# Altium project EN2091_Analog_Project.PrjPcb
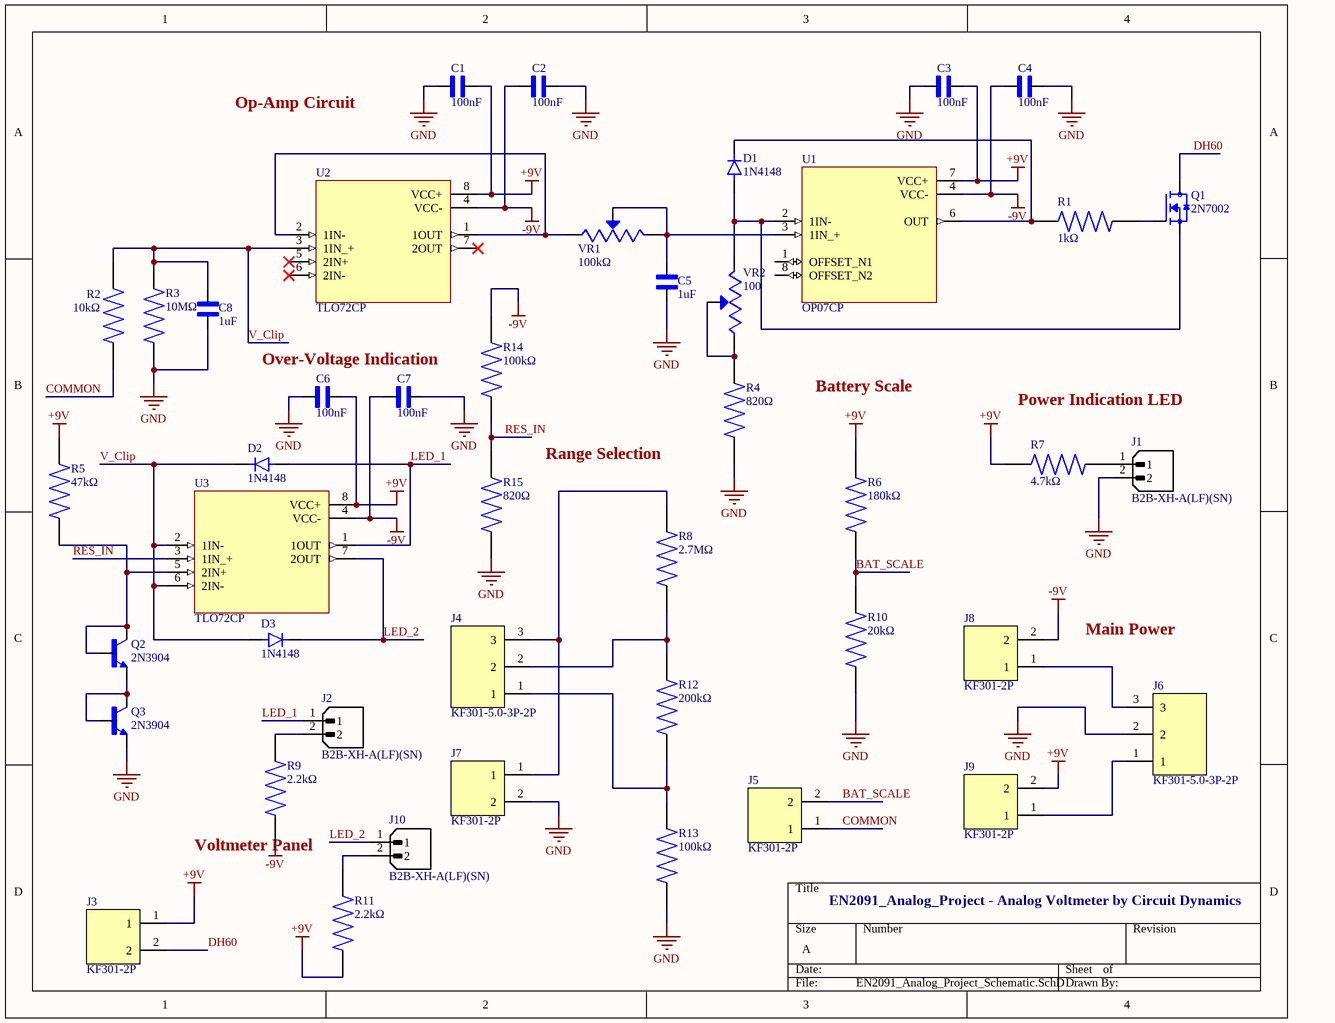
[diagram p0: EN2091_Analog_Project_Schematic.SchDoc]
1 sheet, 44 parts. Net scope: global (net labels, ports and power ports of the same name join across sheets).
Board file: EN2091_Analog_Project_PCB.PcbDoc

## Sheet EN2091_Analog_Project_Schematic.SchDoc: Analog Voltmeter
size A; SheetNumber: 1; SheetTotal: 1

### Parts
C1  100nF  [CAPC2012X95N]
C2  100nF  [CAPC2012X95N]
C3  100nF  [CAPC2012X95N]
C4  100nF  [CAPC2012X95N]
C5  1uF  [CAPC2012X135N]
C6  100nF  [CAPC2012X95N]
C7  100nF  [CAPC2012X95N]
C8  1uF  [CAPC2012X135N]
D1  1N4148  [AXIAL_017AG_T26_ONS]
D2  1N4148  [AXIAL_017AG_T26_ONS]
D3  1N4148  [AXIAL_017AG_T26_ONS]
J1  B2B-XH-A(LF)(SN)  [JST_B2B-XH-A(LF)(SN)]
J2  B2B-XH-A(LF)(SN)  [JST_B2B-XH-A(LF)(SN)]
J3  KF301-2P  [HANDSON_KF301-2P]
J4  KF301-5.0-3P-2P  [HANDSON_KF301-3P]
J5  KF301-2P  [HANDSON_KF301-2P]
J6  KF301-5.0-3P-2P  [HANDSON_KF301-3P]
J7  KF301-2P  [HANDSON_KF301-2P]
J8  KF301-2P  [HANDSON_KF301-2P]
J9  KF301-2P  [HANDSON_KF301-2P]
J10  B2B-XH-A(LF)(SN)  [JST_B2B-XH-A(LF)(SN)]
Q1  2N7002  [TRANS_2N7002]
Q2  2N3904  [TO92254P460H750-3]
Q3  2N3904  [TO92254P460H750-3]
R1  1kΩ  [RESAD1100W55L680D260]
R2  10kΩ  [RESAD1100W55L680D260]
R3  10MΩ  [RESAD1100W55L680D260]
R4  820Ω  [RESAD1100W55L680D260]
R5  47kΩ  [RESAD1100W55L680D260]
R6  180kΩ  [RESAD1100W55L680D260]
R7  4.7kΩ  [RESAD1100W55L680D260]
R8  2.7MΩ  [RESAD1100W55L680D260]
R9  2.2kΩ  [RESAD1100W55L680D260]
R10  20kΩ  [RESAD1100W55L680D260]
R11  2.2kΩ  [RESAD1100W55L680D260]
R12  200kΩ  [RESAD1100W55L680D260]
R13  100kΩ  [RESAD1100W55L680D260]
R14  100kΩ  [RESAD1100W55L680D260]
R15  820Ω  [RESAD1100W55L680D260]
U1  OP07CP  [DIP794W45P254L959H508Q8]
U2  TLO72CP  [DIP794W45P254L959H508Q8]
U3  TLO72CP  [DIP794W45P254L959H508Q8]
VR1  100kΩ  [TRIM_3296W-1-104LF]
VR2  100  [TRIM_3296W-1-101]

### Nets
+9V: C1.2 C3.2 C6.2 J3.1 J9.2 R5.1 R6.2 R7.1 R11.1 U1.7(VCC+) U2.8(VCC+) U3.8(VCC+)
-9V: C2.1 C4.1 C7.1 J8.2 R9.1 R14.2 U1.4(VCC-) U2.4(VCC-) U3.4(VCC-)
GND: C1.1 C2.2 C3.1 C4.2 C5.1 C6.1 C7.2 C8.1 J1.2 J6.2 J7.2 Q3.1(E) R3.1 R4.1 R10.1 R13.1 R15.1
BAT_SCALE: J5.2 R6.1 R10.2
COMMON: J5.1 R2.1
DH60: J3.2 Q1.3(D)
LED_1: D2.2 J2.1 U3.1(1OUT)
LED_2: D3.1 J10.1 U3.7(2OUT)
RES_IN: R14.1 R15.2 U3.3(1IN_+)
V_Clip: C8.2 D2.1 D3.2 R2.2 R3.2 U2.3(1IN_+) U3.2(1IN-) U3.6(2IN-)
NetC5_2: C5.2 U1.3(1IN_+) VR1.2(WIPER) VR1.3(CW)
NetD1_1: D1.1 R1.1 U1.6(OUT)
NetD1_2: D1.2 Q1.2(S) U1.2(1IN-) VR2.3(CW)
NetJ1_1: J1.1 R7.2
NetJ2_2: J2.2 R9.2
NetJ4_1: J4.1 R12.1 R13.2
NetJ4_2: J4.2 R8.1 R12.2
NetJ4_3: J4.3 J7.1 R8.2
NetJ6_1: J6.1 J9.1
NetJ6_3: J6.3 J8.1
NetJ10_2: J10.2 R11.2
NetQ1_1: Q1.1(G) R1.2
NetQ2_1: Q2.1(E) Q3.2(B) Q3.3(C)
NetQ2_2: Q2.2(B) Q2.3(C) R5.2 U3.5(2IN+)
NetR4_2: R4.2 VR2.1(CCW) VR2.2(WIPER)
NetU2_1: U2.1(1OUT) U2.2(1IN-) VR1.1(CCW)

Not connected (* = marked no-connect by the designer): U1 1(OFFSET_N1) 8(OFFSET_N2); U2 5(2IN+)* 6(2IN-)* 7(2OUT)*

### Notes on the sheet
- Op-Amp Circuit
- Over-Voltage Indication
- Battery Scale
- Power Indication LED
- Range Selection
- Main Power
- Voltmeter Panel
- EN2091_Analog_Project - Analog Voltmeter by Circuit Dynamics

### Library data of the parts
C1-C4 C6 C7 = CL21B104KBCNNNC: 100nF 50V X7R ±10% 0805 Multilayer Ceramic Capacitors MLCC - SMD/SMT ROHS; MF: Samsung Electro-Mechanics; SnapEDA_Link: https://www.snapeda.com/parts/CL21B104KBCNNNC/Samsung/view-part/?ref=snap; Package: SMD-2 Samsung; Value: 100nF; MP: CL21B104KBCNNNC; Check_prices: https://www.snapeda.com/parts/CL21B104KBCNNNC/Samsung/view-part/?ref=eda; LCSC Part Number: C1711; JLCPCB Part Number: C1711; Packaging: 0805; Datasheet: https://jlc-prod-smt.oss-eu-central-1.aliyuncs.com/smtDataManualFile/8586177282230652928-C1711.pdf?response-content-disposition=attachment%3B%20filename%3DC1711.pdf%3B%20filename%2A%3DUTF-8%27%27C1711.pdf&x-oss-date=20260824T081709Z&x-oss-expires=1800&x-oss-security-token=CAISgAN1q6Ft5B2yfSjIr5mGHfDOn7QT7o%2BxUBDlk1MZdulkpK3jlDz2IHhMdHJsAOodtv0%2FmmhT6PkclqRLcbhpcmfjV%2BZHzLB8qZEGg3sq557b16cNrbH4M4H6aXeirtuwDsz9SNTCALjPD3nPii50x5bjaDymRCbLGJaViJlhHLN1Ow6jdmhpCctxLAlvo9NgFxm3D%2Fu2NQPwiWf9FVdhvhEG6Vly8qOi2MaRmFy8yFTx0b0SvJ%2BjYMrmPctoN9JnSdC5mfdzau3a1TJ84gRD0a5wkaVA1zbDs5bfISEIuUzebreLqY03dV4mOvdqIcMe8qigz88fk%2FfIioH6xyxKOexoSCnFTOiiupCcQLPyao9jLu6iayqViY7QaIOTqQohZmkAMwVOasAsI3Ngh4zF97Qt0cVNkXO9gWfLI8DtuMleWgooUt9U86HD0eS19jklBdzSlusJRAJJUVBflCeKEaRNSAd3WGhEfM2%2BBt4QT30w5N2u00S8OSMI7RV3BqKWD5sagAGgO1DD6BoixGcj7OM8XS0gibNrLNvx9htutE794D0zttbwnpxTrwll4sF3BZcc4f4feWxI7%2Bt9GmtQtPB9CcN1OsLaOdxgI0xrNzXh3GP5koq13GIWxRMcGYuQFx2sstxck4NbO5PxcqvOTQCJgYZ8SZgvAsPo3E1SdW304xHJtyAA&x-oss-signature-version=OSS4-HMAC-SHA256&x-oss-credential=STS.NZ3VJzrk2YMZR6TwSLzfHKhHv%2F20260824%2Feu-central-1%2Foss%2Faliyun_v4_request&x-oss-signature=b522eb2391a6902924f48a327a7f41585dc420bf07b5c2db532034d436f7e6a7
C5 C8 = CL21B105KBFNNNE: 1uF 50V X7R ±10% 0805 Multilayer Ceramic Capacitors MLCC - SMD/SMT ROHS; MF: Samsung Electro-Mechanics; SnapEDA_Link: https://www.snapeda.com/parts/CL21B105KBFNNNE/Samsung/view-part/?ref=snap; Package: SMD-2 Samsung; Value: 1uF; MP: CL21B105KBFNNNE; Check_prices: https://www.snapeda.com/parts/CL21B105KBFNNNE/Samsung/view-part/?ref=eda; LCSC Part Number: C28323; JLCPCB Part Number: C28323; Packaging: 0805
D1-D3 = 1N4148: -55℃~+175℃@(Tj) 1 Independent 100V 1V@10mA 200mA 4A 4ns 500mW 5uA@75V DO-35 Switching Diodes ROHS; MF: onsemi; SnapEDA_Link: https://www.snapeda.com/parts/1N4148/Onsemi/view-part/?ref=snap; Package: AXIAL LEAD-2 ON Semiconductor; Value: *; MP: 1N4148; Check_prices: https://www.snapeda.com/parts/1N4148/Onsemi/view-part/?ref=eda; LCSC Part Number: C258182; JLCPCB Part Number: C258182; Packaging: DO-35; ComponentLink1Description: Datasheet; ComponentLink1URL: https://jlc-prod-smt.oss-eu-central-1.aliyuncs.com/smtDataManualFile/8588891516693987328-C258182.pdf?response-content-disposition=attachment%3B%20filename%3DC258182.pdf%3B%20filename%2A%3DUTF-8%27%27C258182.pdf&x-oss-date=20260824T123915Z&x-oss-expires=1800&x-oss-security-token=CAISgAN1q6Ft5B2yfSjIr5nHLfzkqI4Zj7uFb1Hwr3kzdMRFu6LJ0Dz2IHhMdHJsAOodtv0%2FmmhT6PkclqRLcbhpcmfjV%2BZHzLB8qb4h%2FEIq557b16cNrbH4M4H6aXeirtuwDsz9SNTCALjPD3nPii50x5bjaDymRCbLGJaViJlhHLN1Ow6jdmhpCctxLAlvo9NgFxm3D%2Fu2NQPwiWf9FVdhvhEG6Vly8qOi2MaRmFy8yFTx0b0SvJ%2BjYMrmPctoN9JnSdC5mfdzau3a1TJ84gRD0a5wkaVA1zbDs5bfISEIuUzebreLqY03dV4mOvdqIcMe8qigz88fk%2FfIioH6xyxKOexoSCnFTOiiupCcQLPyao9jLu6iayqViY7QaIOTqQohZmkAMwVOasAsI3Ngh4zF97Qt0cVNkXO9gWfLI8DtuMleWkqnSf1c86HD0eS19jklBdzSlusJRAJJUVBflCeKEaRNSAd3WGhEfM2%2BBt4QT30w5N2u00S8OSMI7u2NB6KWD5sagAGr3foMo08u0hg4sPaEAhHejaX1K1vtCq0Rs3qdLPQjOHAU3bA2D2pDPhPzXRnKBDFNRw25yQAe0B8ZutJyzVczHfRc5aN9y5%2BVFQff1we5D3ylmkox3228fiPTPzdY0dulDcVIUusk1MruY%2FGuZ4TocXsP7T7%2BnIgiC75d%2B8yAUSAA&x-oss-signature-version=OSS4-HMAC-SHA256&x-oss-credential=STS.NZrfFPEQ88ynmwAKyfxKiTgb2%2F20260824%2Feu-central-1%2Foss%2Faliyun_v4_request&x-oss-signature=7d31f57c4ca03725e030b844e767f49808b97d5660530bc99b6cfe814330b3c1
J1 J2 J10 = B2B-XH-A(LF)(SN): Connector Header Through Hole 2 position 0.098 (2.50mm); MF: XYECONN; MP: XY-B2B-XH-A; SnapEDA_Link: https://www.snapeda.com/parts/B2B-XH-A(LF)(SN)/JST/view-part/?ref=snap; Package: None; Value: *; Check_prices: https://www.snapeda.com/parts/B2B-XH-A(LF)(SN)/JST/view-part/?ref=eda; LCSC Part Number: C51940134; JLCPCB Part Number: C51940134; ComponentLink1Description: Datasheet; ComponentLink1URL: https://jlc-prod-smt.oss-eu-central-1.aliyuncs.com/smtDataManualFile/8756873389292032000-C51940134.pdf?response-content-disposition=attachment%3B%20filename%3DC51940134.pdf%3B%20filename%2A%3DUTF-8%27%27C51940134.pdf&x-oss-date=20260825T073214Z&x-oss-expires=1800&x-oss-security-token=CAISgAN1q6Ft5B2yfSjIr5vHL4nsm71Gw%2FTYUEzanjcPNNsbqIb5oTz2IHhMdHJsAOodtv0%2FmmhT6PkclqRLcbhpcmfjV%2BZHzLB8qfZMiiAq557b16cNrbH4M4H6aXeirtuwDsz9SNTCALjPD3nPii50x5bjaDymRCbLGJaViJlhHLN1Ow6jdmhpCctxLAlvo9NgFxm3D%2Fu2NQPwiWf9FVdhvhEG6Vly8qOi2MaRmFy8yFTx0b0SvJ%2BjYMrmPctoN9JnSdC5mfdzau3a1TJ84gRD0a5wkaVA1zbDs5bfISEIuUzebreLqY03dV4mOvdqIcMe8qigz88fk%2FfIioH6xyxKOexoSCnFTOiiupCcQLPyao9jLu6iayqViY7QaIOTqQohZmkAMwVOasAsI3Ngh4zF97Qt0cVNkXO9gWfLI8DtuMleWmpmXdk%2B86HD0eS19jklBdzSlusJRAJJUVBflCeKEaRNSAd3WGhEfM2%2BBt4QT30w5N2u00S8OSMIxfnStaKWD5sagAGDiiDi0jkdUes8cqMbd0CGciys9ki7pIZkKsKqj9ZCxgmTVFKmonOvhB0GCq%2B31OjjHM0VTB2zOVgjvkRo1ZZOD%2FLtMbwaPXos31FS3eqvfpK6qEPBU1QuFMi8nemEpSEsfpKHEGo3PQQniW1S1jM94Dta3jYoawqx25WNx82BmSAA&x-oss-signature-version=OSS4-HMAC-SHA256&x-oss-credential=STS.NXrd3Xvbgt63Rjkz7Z8T7GCRC%2F20260825%2Feu-central-1%2Foss%2Faliyun_v4_request&x-oss-signature=ea0af44fa6bb8676878fee5e34cce7cfde54a6f68248ff1658e78184a3f7ef54
J3 J5 J7-J9 = KF301-2P: 2 Pin Terminal Block 5mm Pitch / -30℃~+120℃ 1 1.5 14~22 17A 1x2P 2 250V 2P 5mm Blue Through Hole 插件,P=5mm Screw Terminal Blocks ROHS; MF: Handson Technology; SnapEDA_Link: https://www.snapeda.com/parts/KF301-2P/Handson+Technology/view-part/?ref=snap; Package: None; Value: *; MP: KF301-2P; Check_prices: https://www.snapeda.com/parts/KF301-2P/Handson+Technology/view-part/?ref=eda; LCSC Part Number: C474881; JLCPCB Part Number: C474881; ComponentLink1Description: Datasheet; ComponentLink1URL: https://jlc-prod-smt.oss-eu-central-1.aliyuncs.com/smtDataManualFile/8588888669994561536-C474881.pdf?response-content-disposition=attachment%3B%20filename%3DC474881.pdf%3B%20filename%2A%3DUTF-8%27%27C474881.pdf&x-oss-date=20260825T075455Z&x-oss-expires=1800&x-oss-security-token=CAISgAN1q6Ft5B2yfSjIr5vHL4nsm71Gw%2FTYUEzanjcPNNsbqIb5oTz2IHhMdHJsAOodtv0%2FmmhT6PkclqRLcbhpcmfjV%2BZHzLB8qfZMiiAq557b16cNrbH4M4H6aXeirtuwDsz9SNTCALjPD3nPii50x5bjaDymRCbLGJaViJlhHLN1Ow6jdmhpCctxLAlvo9NgFxm3D%2Fu2NQPwiWf9FVdhvhEG6Vly8qOi2MaRmFy8yFTx0b0SvJ%2BjYMrmPctoN9JnSdC5mfdzau3a1TJ84gRD0a5wkaVA1zbDs5bfISEIuUzebreLqY03dV4mOvdqIcMe8qigz88fk%2FfIioH6xyxKOexoSCnFTOiiupCcQLPyao9jLu6iayqViY7QaIOTqQohZmkAMwVOasAsI3Ngh4zF97Qt0cVNkXO9gWfLI8DtuMleWmpmXdk%2B86HD0eS19jklBdzSlusJRAJJUVBflCeKEaRNSAd3WGhEfM2%2BBt4QT30w5N2u00S8OSMIxfnStaKWD5sagAGDiiDi0jkdUes8cqMbd0CGciys9ki7pIZkKsKqj9ZCxgmTVFKmonOvhB0GCq%2B31OjjHM0VTB2zOVgjvkRo1ZZOD%2FLtMbwaPXos31FS3eqvfpK6qEPBU1QuFMi8nemEpSEsfpKHEGo3PQQniW1S1jM94Dta3jYoawqx25WNx82BmSAA&x-oss-signature-version=OSS4-HMAC-SHA256&x-oss-credential=STS.NXrd3Xvbgt63Rjkz7Z8T7GCRC%2F20260825%2Feu-central-1%2Foss%2Faliyun_v4_request&x-oss-signature=bbaa85c5a5c7e0f3858a29c7e7e1ce60f942b031d33e9564a46d8b874bcb652f
J4 J6 = KF301-5.0-3P: -30℃~+120℃ 1 1.5 14~22 17A 1x3P 250V 3 3P 5mm Blue Through Hole 插件,P=5mm Screw Terminal Blocks ROHS; MF: Cixi Kefa Elec; Package: None; Value: *; MP: KF301-5.0-3P; LCSC Part Number: C474882; JLCPCB Part Number: C474882; ComponentLink1Description: Datasheet; ComponentLink1URL: https://jlc-prod-smt.oss-eu-central-1.aliyuncs.com/smtDataManualFile/8588888670002139136-C474882.pdf?response-content-disposition=attachment%3B%20filename%3DC474882.pdf%3B%20filename%2A%3DUTF-8%27%27C474882.pdf&x-oss-date=20260825T083909Z&x-oss-expires=1800&x-oss-security-token=CAISgAN1q6Ft5B2yfSjIr5rwIOuAjLBXwqqKMWTCgWMCOtsegaHIujz2IHhMdHJsAOodtv0%2FmmhT6PkclqRLcbhpcmfjV%2BZHzLB8qZALwSEq557b16cNrbH4M4H6aXeirtuwDsz9SNTCALjPD3nPii50x5bjaDymRCbLGJaViJlhHLN1Ow6jdmhpCctxLAlvo9NgFxm3D%2Fu2NQPwiWf9FVdhvhEG6Vly8qOi2MaRmFy8yFTx0b0SvJ%2BjYMrmPctoN9JnSdC5mfdzau3a1TJ84gRD0a5wkaVA1zbDs5bfISEIuUzebreLqY03dV4mOvdqIcMe8qigz88fk%2FfIioH6xyxKOexoSCnFTOiiupCcQLPyao9jLu6iayqViY7QaIOTqQohZmkAMwVOasAsI3Ngh4zF97Qt0cVNkXO9gWfLI8DtuMleWgrAlsTAJjvyAFpORa%2Bb5wchMHn6pr9EWOXuJZUIn3b%2FstWNupKq5ldctHSeoXq108CXVnU5PXYIxekA9aKWD5sagAEUyPntyVyU4V2IqafEejF6luaUGOW8giT03zBmI%2F4BLLNNju2GWhPwbRm8GlAGTmkaDwxIN4%2Bg6sd2cUpZg6tRnuiIoRrRfPgk9f8sDOnBhHkSyvlZEJc0XYnr%2F5yKzo8GBOg%2BMmFY724RtfEMwd4PQLZAoVJL30q4tKoTMBKqVSAA&x-oss-signature-version=OSS4-HMAC-SHA256&x-oss-credential=STS.NYEkQ4aovuha3BsecW6T2ndcX%2F20260825%2Feu-central-1%2Foss%2Faliyun_v4_request&x-oss-signature=8e8a3bf5e7e8f5cc52ed862cda921fd13cbe209f163a0669e8eafba254ac342d
Q1 = 2N7002: MOSFET, SOT-23, N, 60V, 0.28A, 5|, 150°C / 1 N-channel 115mA 2.5V 225mW 25pF 50pF 5pF 5Ω@10V 60V N-Channel ±20V SOT-23 MOSFETs ROHS; MF: Diotec Semiconductor; SnapEDA_Link: https://www.snapeda.com/parts/2N7002/Diotec/view-part/?ref=snap; Package: SOT-23 Diotec; Value: *; MP: 2N7002; Check_prices: https://www.snapeda.com/parts/2N7002/Diotec/view-part/?ref=eda; LCSC Part Number: C8545; JLCPCB Part Number: C8545; Packaging: SOT-23; ComponentLink1Description: Datasheet; ComponentLink1URL: https://jlc-prod-smt.oss-eu-central-1.aliyuncs.com/smtDataManualFile/8550724090240786432-C8545.pdf?response-content-disposition=attachment%3B%20filename%3DC8545.pdf%3B%20filename%2A%3DUTF-8%27%27C8545.pdf&x-oss-date=20260824T115715Z&x-oss-expires=1800&x-oss-security-token=CAISgAN1q6Ft5B2yfSjIr5nXMuv%2BvJV0wLuud0CI01ctdutUt%2FLArjz2IHhMdHJsAOodtv0%2FmmhT6PkclqRLcbhpcmfjV%2BZHzLB8qYl7pX0q557b16cNrbH4M4H6aXeirtuwDsz9SNTCALjPD3nPii50x5bjaDymRCbLGJaViJlhHLN1Ow6jdmhpCctxLAlvo9NgFxm3D%2Fu2NQPwiWf9FVdhvhEG6Vly8qOi2MaRmFy8yFTx0b0SvJ%2BjYMrmPctoN9JnSdC5mfdzau3a1TJ84gRD0a5wkaVA1zbDs5bfISEIuUzebreLqY03dV4mOvdqIcMe8qigz88fk%2FfIioH6xyxKOexoSCnFTOiiupCcQLPyao9jLu6iayqViY7QaIOTqQohZmkAMwVOasAsI3Ngh4zF97Qt0cVNkXO9gWfLI8DtuMleWorpROZs86HD0eS19jklBdzSlusJRAJJUVBflCeKEaRNSAd3WGhEfM2%2BBt4QT30w5N2u00S8OSMIdZUZHKKWD5sagAGIeDksTl0Jm8kDpNZyqXpos4Fia7krhozzbA5lHdi6hZhStnsllffk9Jy6LPikYdJXwHUZMD5tauOV%2FJMMuvlTmOopNPyucKakhx7CKF22jSXQNt5usakIFMasHgZAabS%2FMCHZQVcujW3F%2B80DFAHUjbh%2B1%2FCP8kr3l2njSUlPuCAA&x-oss-signature-version=OSS4-HMAC-SHA256&x-oss-credential=STS.NZbyQJQJUwyEuf97WxzdxX7kL%2F20260824%2Feu-central-1%2Foss%2Faliyun_v4_request&x-oss-signature=f53d934e69d13818cb32edbd0d068395a096e2f8396aa90dd858349e40b679ed
Q2 Q3 = 2N3904: 1 NPN 100 200mA 300MHz 300mV 40V 50nA 625mW 6V NPN TO-92 Bipolar (BJT) ROHS; MF: Diotec Semiconductor; SnapEDA_Link: https://www.snapeda.com/parts/2N3904/Diotec/view-part/?ref=snap; Package: TO-92 Diotec; Value: *; MP: 2N3904; Check_prices: https://www.snapeda.com/parts/2N3904/Diotec/view-part/?ref=eda; JLCPCB Part Number: C118538; LCSC Part Number: C118538; Packaging: TO-92; ComponentLink1Description: Datasheet; ComponentLink1URL: https://jlc-prod-smt.oss-eu-central-1.aliyuncs.com/smtDataManualFile/8588887652326387712-C118538.pdf?response-content-disposition=attachment%3B%20filename%3DC118538.pdf%3B%20filename%2A%3DUTF-8%27%27C118538.pdf&x-oss-date=20260911T151354Z&x-oss-expires=1800&x-oss-security-token=CAISgAN1q6Ft5B2yfSjIr5r9CI7lmOhw0YeyZVLIjkcBdcR9gfOa0Dz2IHhMdHJsAOodtv0%2FmmhT6PkclqRLcbhpcmfjV%2BZHzLB8qfNbr2kg557b16cNrbH4M4H6aXeirtuwDsz9SNTCALjPD3nPii50x5bjaDymRCbLGJaViJlhHLN1Ow6jdmhpCctxLAlvo9NgFxm3D%2Fu2NQPwiWf9FVdhvhEG6Vly8qOi2MaRmFy8yFTx0b0SvJ%2BjYMrmPctoN9JnSdC5mfdzau3a1TJ84gRD0a5wkaVA1zbDs5bfISEIuUzebreLqY03dV4mOvdqIcMe8qigz88fk%2FfIioH6xyxKOexoSCnFTOiiupCcQLPyao9jLu6iayqViY7QaIOTqQohZmkAMwVOasAsI3Ngh4zF97Qt0cVNkXO9gWfLI8DtuMleWmpsRHD7MjvyAFpORa%2Bb5wchMHn6pr9EWOXuJZUIn3b%2FstWNupKq5ldctHSeoXq108CXVnU5PXYIwBNhyqKWD5sagAG1Z1Ko3snZsjO1a1IJYsOspEmZv0%2BXU7OWdkAiwCQrcVVnAyAHbGZ8aZQx2jgys%2BVPP%2BjAliJD6sDK0ERwYbIs0pE%2F%2FOGQAkhN6WXgpQltR1W2sWSdxX5ATy6ua1TtneTFxF379HftCAEbgKOmHPbiz9tzW%2FV9N%2FCwVMnmnzFeoCAA&x-oss-signature-version=OSS4-HMAC-SHA256&x-oss-credential=STS.NYHC4Qu7QfEYgtyjGTyKQn612%2F20260911%2Feu-central-1%2Foss%2Faliyun_v4_request&x-oss-signature=5f7e3dfff60f0fba263af33bfa5ea5d7b517f9c0befd2510f0af956be3220f3d
R1 = MFR-25FTE52-1K: -55℃~+155℃ 1kΩ 250mW Metal Film Resistor ±1% ±50ppm/℃ 插件,D2.4xL6.3mm Through Hole Resistors ROHS; Manufacturer: YAGEO; Value: 1kΩ; Manufacturer Part Number: MFR-25FTE52-1K; LCSC Part Number: C172978; JLCPCB Part Number: C172978; Package: Plugin,D2.4xL6.3mm; ComponentLink1Description: Footprint; ComponentLink1URL: https://jlc-prod-smt.oss-eu-central-1.aliyuncs.com/smtDataManualFile/8755423044993605632-C172978.pdf?response-content-disposition=attachment%3B%20filename%3DC172978.pdf%3B%20filename%2A%3DUTF-8%27%27C172978.pdf&x-oss-date=20260906T111132Z&x-oss-expires=1800&x-oss-security-token=CAISgAN1q6Ft5B2yfSjIr5nac%2Bnsjo1T4LGgNU%2FHnTM8eNdtpKDsuzz2IHhMdHJsAOodtv0%2FmmhT6PkclqRLcbhpcmfjV%2BZHzLB8qaYz1FQu557b16cNrbH4M4H6aXeirtuwDsz9SNTCALjPD3nPii50x5bjaDymRCbLGJaViJlhHLN1Ow6jdmhpCctxLAlvo9NgFxm3D%2Fu2NQPwiWf9FVdhvhEG6Vly8qOi2MaRmFy8yFTx0b0SvJ%2BjYMrmPctoN9JnSdC5mfdzau3a1TJ84gRD0a5wkaVA1zbDs5bfISEIuUzebreLqY03dV4mOvdqIcMe8qigz88fk%2FfIioH6xyxKOexoSCnFTOiiupCcQLPyao9jLu6iayqViY7QaIOTqQohZmkAMwVOasAsI3Ngh4zF97Qt0cVNkXO9gWfLI8DtuMleWspmx%2Fhm46HD0eS19jklBdzSlusJRAJJUVBflCeKEaRNSAd3WGhEfM2%2BBt4QT30w5N2u00S8OSMImLNMX6KWD5sagAGnBS1pJyigTrIAotemE2%2FZAj5lpuflU6Cx1ne3PKYeUSgx29L1tnEKEw7bHJH4L%2BwcyBF5TIPkAe9wQLoDG2IH%2B7vbpIM5MvPYfjzBbZEibCKyAmKr6BN784HCib%2BC8bhBZ5WQgh34wHbh24tRPUkJ5x6XXfvl0zb7VCnsoRLFQiAA&x-oss-signature-version=OSS4-HMAC-SHA256&x-oss-credential=STS.NZo8SXcRrWsK7ivy3itXAKeGY%2F20260906%2Feu-central-1%2Foss%2Faliyun_v4_request&x-oss-signature=4a93038927de780a1167e2fdc17bc64734a2c7f8ed724f4b04540bf5e082abb1
R2 = MFR-25FTE52-10K: 10kΩ 250V 250mW Metal Film Resistor ±1% ±50ppm/℃ 插件,D2.2xL6.5mm Through Hole Resistors ROHS; Manufacturer: YAGEO; Value: 10kΩ; Manufacturer Part Number: MFR-25FTE52-10K; LCSC Part Number: C172967; JLCPCB Part Number: C172967; Package: https://jlc-prod-smt.oss-eu-central-1.aliyuncs.com/smtDataManualFile/8755418945577209856-C172967.pdf?response-content-disposition=attachment%3B%20filename%3DC172967.pdf%3B%20filename%2A%3DUTF-8%27%27C172967.pdf&x-oss-date=20260906T105853Z&x-oss-expires=1800&x-oss-security-token=CAISgAN1q6Ft5B2yfSjIr5vSO4%2FhhZxI%2Bq2YSHX0pTQQY%2BQe2%2FboiDz2IHhMdHJsAOodtv0%2FmmhT6PkclqRLcbhpcmfjV%2BZHzLB8qZREnVcu557b16cNrbH4M4H6aXeirtuwDsz9SNTCALjPD3nPii50x5bjaDymRCbLGJaViJlhHLN1Ow6jdmhpCctxLAlvo9NgFxm3D%2Fu2NQPwiWf9FVdhvhEG6Vly8qOi2MaRmFy8yFTx0b0SvJ%2BjYMrmPctoN9JnSdC5mfdzau3a1TJ84gRD0a5wkaVA1zbDs5bfISEIuUzebreLqY03dV4mOvdqIcMe8qigz88fk%2FfIioH6xyxKOexoSCnFTOiiupCcQLPyao9jLu6iayqViY7QaIOTqQohZmkAMwVOasAsI3Ngh4zF97Qt0cVNkXO9gWfLI8DtuMleWgpiXuNG46HD0eS19jklBdzSlusJRAJJUVBflCeKEaRNSAd3WGhEfM2%2BBt4QT30w5N2u00S8OSMIYHF9RqKWD5sagAGbau%2Fxe%2BD2roMehcOdm0PLMv7W398Wd9qW6auWIGOJ8yM2mufMKnNuzKDZRrB2n8xqRfVoivNI%2BCfeVUSVLsJDjlvzZ31AQToMdhBOrAOSV9wuJpTD8m86LQRz159fZvu2CuBzwfmd%2B8wbWeOtwDoLyWx%2Bd%2F0Ka0FLrv%2FIvuL9IyAA&x-oss-signature-version=OSS4-HMAC-SHA256&x-oss-credential=STS.NXgp5UhCiMosJSEA4Eok243Cj%2F20260906%2Feu-central-1%2Foss%2Faliyun_v4_request&x-oss-signature=027985dfe1697d3c93addd91df9663f85f41fcc0b4f91978383751338c84ded9; ComponentLink1Description: Footprint; ComponentLink1URL: https://jlc-prod-smt.oss-eu-central-1.aliyuncs.com/smtDataManualFile/8588887064650141696-C57436.pdf?response-content-disposition=attachment%3B%20filename%3DC57436.pdf%3B%20filename%2A%3DUTF-8%27%27C57436.pdf&x-oss-date=20260906T101707Z&x-oss-expires=1800&x-oss-security-token=CAISgAN1q6Ft5B2yfSjIr5vSO4%2FhhZxI%2Bq2YSHX0pTQQY%2BQe2%2FboiDz2IHhMdHJsAOodtv0%2FmmhT6PkclqRLcbhpcmfjV%2BZHzLB8qZREnVcu557b16cNrbH4M4H6aXeirtuwDsz9SNTCALjPD3nPii50x5bjaDymRCbLGJaViJlhHLN1Ow6jdmhpCctxLAlvo9NgFxm3D%2Fu2NQPwiWf9FVdhvhEG6Vly8qOi2MaRmFy8yFTx0b0SvJ%2BjYMrmPctoN9JnSdC5mfdzau3a1TJ84gRD0a5wkaVA1zbDs5bfISEIuUzebreLqY03dV4mOvdqIcMe8qigz88fk%2FfIioH6xyxKOexoSCnFTOiiupCcQLPyao9jLu6iayqViY7QaIOTqQohZmkAMwVOasAsI3Ngh4zF97Qt0cVNkXO9gWfLI8DtuMleWgpiXuNG46HD0eS19jklBdzSlusJRAJJUVBflCeKEaRNSAd3WGhEfM2%2BBt4QT30w5N2u00S8OSMIYHF9RqKWD5sagAGbau%2Fxe%2BD2roMehcOdm0PLMv7W398Wd9qW6auWIGOJ8yM2mufMKnNuzKDZRrB2n8xqRfVoivNI%2BCfeVUSVLsJDjlvzZ31AQToMdhBOrAOSV9wuJpTD8m86LQRz159fZvu2CuBzwfmd%2B8wbWeOtwDoLyWx%2Bd%2F0Ka0FLrv%2FIvuL9IyAA&x-oss-signature-version=OSS4-HMAC-SHA256&x-oss-credential=STS.NXgp5UhCiMosJSEA4Eok243Cj%2F20260906%2Feu-central-1%2Foss%2Faliyun_v4_request&x-oss-signature=a373059562e0e3dfbc50b7320e961e4699e31ef87cd4af9f5203c76fec99a3de
R3 = HHV-25FR-52-10M: -55℃~+155℃ 1.6kV 10MΩ 250mW Metal Film Resistors ±1% ±200ppm/℃ 插件,D2.4xL6.3mm Through Hole Resistors ROHS; Manufacturer: YAGEO; Value: 10MΩ; Manufacturer Part Number: HHV-25FR-52-10M; LCSC Part Number: C1741175; JLCPCB Part Number: C1741175; Package: Plugin,D2.4xL6.3mm; ComponentLink1Description: Footprint; ComponentLink1URL: https://jlc-prod-smt.oss-eu-central-1.aliyuncs.com/smtDataManualFile/8755328648436031488-C1741175.pdf?response-content-disposition=attachment%3B%20filename%3DC1741175.pdf%3B%20filename%2A%3DUTF-8%27%27C1741175.pdf&x-oss-date=20260906T094949Z&x-oss-expires=1800&x-oss-security-token=CAISgAN1q6Ft5B2yfSjIr5rWeez%2Fv7lC0IiPa1bwvEoAT71Ol5bD1zz2IHhMdHJsAOodtv0%2FmmhT6PkclqRLcbhpcmfjV%2BZHzLB8qb4bx1Eu557b16cNrbH4M4H6aXeirtuwDsz9SNTCALjPD3nPii50x5bjaDymRCbLGJaViJlhHLN1Ow6jdmhpCctxLAlvo9NgFxm3D%2Fu2NQPwiWf9FVdhvhEG6Vly8qOi2MaRmFy8yFTx0b0SvJ%2BjYMrmPctoN9JnSdC5mfdzau3a1TJ84gRD0a5wkaVA1zbDs5bfISEIuUzebreLqY03dV4mOvdqIcMe8qigz88fk%2FfIioH6xyxKOexoSCnFTOiiupCcQLPyao9jLu6iayqViY7QaIOTqQohZmkAMwVOasAsI3Ngh4zF97Qt0cVNkXO9gWfLI8DtuMleWkonxNcG46HD0eS19jklBdzSlusJRAJJUVBflCeKEaRNSAd3WGhEfM2%2BBt4QT30w5N2u00S8OSMInBxK8qKWD5sagAE4UE4gskISDgkkmUOAOqQkmxDERSgRapehmtIyqiUnmINqf%2Fe7mduu7Yr1h7WdN14VCvYzNhyIHZnwotTufqqI9gqQmPxd7MybCmWa9YrQOa6FH4HxAfg%2FPn30MZ%2BuqC8fyTltcZzXzlZfTkArX8MWh2hCnLGuQWVjeheR9INpwyAA&x-oss-signature-version=OSS4-HMAC-SHA256&x-oss-credential=STS.NYc2VKRfcgJdipAXJUC2bxSh5%2F20260906%2Feu-central-1%2Foss%2Faliyun_v4_request&x-oss-signature=c9bb8ade5495b9c36b4e24ae95a96a0ffed89de77ee1bfec24146fbeec18ca78
R4 R15 = MFR-25FRF52-820R: -55℃~+155℃ 250mW 820Ω Metal Film Resistor ±1% ±100ppm/℃ 插件,D2.4xL6.3mm Through Hole Resistors ROHS; Manufacturer: YAGEO; Value: 820Ω; Manufacturer Part Number: MFR-25FRF52-820R; LCSC Part Number: C1743583; JLCPCB Part Number: C1743583; Package: Plugin,D2.4xL6.3mm; ComponentLink1Description: Footprint; ComponentLink1URL: https://jlc-prod-smt.oss-eu-central-1.aliyuncs.com/smtDataManualFile/8755394679539929088-C1743583.pdf?response-content-disposition=attachment%3B%20filename%3DC1743583.pdf%3B%20filename%2A%3DUTF-8%27%27C1743583.pdf&x-oss-date=20260906T111339Z&x-oss-expires=1800&x-oss-security-token=CAISgAN1q6Ft5B2yfSjIr5nac%2Bnsjo1T4LGgNU%2FHnTM8eNdtpKDsuzz2IHhMdHJsAOodtv0%2FmmhT6PkclqRLcbhpcmfjV%2BZHzLB8qaYz1FQu557b16cNrbH4M4H6aXeirtuwDsz9SNTCALjPD3nPii50x5bjaDymRCbLGJaViJlhHLN1Ow6jdmhpCctxLAlvo9NgFxm3D%2Fu2NQPwiWf9FVdhvhEG6Vly8qOi2MaRmFy8yFTx0b0SvJ%2BjYMrmPctoN9JnSdC5mfdzau3a1TJ84gRD0a5wkaVA1zbDs5bfISEIuUzebreLqY03dV4mOvdqIcMe8qigz88fk%2FfIioH6xyxKOexoSCnFTOiiupCcQLPyao9jLu6iayqViY7QaIOTqQohZmkAMwVOasAsI3Ngh4zF97Qt0cVNkXO9gWfLI8DtuMleWspmx%2Fhm46HD0eS19jklBdzSlusJRAJJUVBflCeKEaRNSAd3WGhEfM2%2BBt4QT30w5N2u00S8OSMImLNMX6KWD5sagAGnBS1pJyigTrIAotemE2%2FZAj5lpuflU6Cx1ne3PKYeUSgx29L1tnEKEw7bHJH4L%2BwcyBF5TIPkAe9wQLoDG2IH%2B7vbpIM5MvPYfjzBbZEibCKyAmKr6BN784HCib%2BC8bhBZ5WQgh34wHbh24tRPUkJ5x6XXfvl0zb7VCnsoRLFQiAA&x-oss-signature-version=OSS4-HMAC-SHA256&x-oss-credential=STS.NZo8SXcRrWsK7ivy3itXAKeGY%2F20260906%2Feu-central-1%2Foss%2Faliyun_v4_request&x-oss-signature=233dab8b7b4060aecf0cba190d8c40d32b47362045e2275f98ec60f582b2fb12
R5 = MFR-25FTE52-47K: -55℃~+155℃ 250mW 47kΩ Metal Film Resistor ±1% ±50ppm/℃ 插件,D2.4xL6.3mm Through Hole Resistors ROHS; Manufacturer: YAGEO; Value: 47kΩ; Manufacturer Part Number: MFR-25FTE52-47K; LCSC Part Number: C173021; JLCPCB Part Number: C173021; Package: Plugin,D2.4xL6.3mm; ComponentLink1Description: Footprint; ComponentLink1URL: https://jlc-prod-smt.oss-eu-central-1.aliyuncs.com/smtDataManualFile/8588890296134881280-C173021.pdf?response-content-disposition=attachment%3B%20filename%3DC173021.pdf%3B%20filename%2A%3DUTF-8%27%27C173021.pdf&x-oss-date=20260911T155232Z&x-oss-expires=1800&x-oss-security-token=CAISgAN1q6Ft5B2yfSjIr5r9CI7lmOhw0YeyZVLIjkcBdcR9gfOa0Dz2IHhMdHJsAOodtv0%2FmmhT6PkclqRLcbhpcmfjV%2BZHzLB8qfNbr2kg557b16cNrbH4M4H6aXeirtuwDsz9SNTCALjPD3nPii50x5bjaDymRCbLGJaViJlhHLN1Ow6jdmhpCctxLAlvo9NgFxm3D%2Fu2NQPwiWf9FVdhvhEG6Vly8qOi2MaRmFy8yFTx0b0SvJ%2BjYMrmPctoN9JnSdC5mfdzau3a1TJ84gRD0a5wkaVA1zbDs5bfISEIuUzebreLqY03dV4mOvdqIcMe8qigz88fk%2FfIioH6xyxKOexoSCnFTOiiupCcQLPyao9jLu6iayqViY7QaIOTqQohZmkAMwVOasAsI3Ngh4zF97Qt0cVNkXO9gWfLI8DtuMleWmpsRHD7MjvyAFpORa%2Bb5wchMHn6pr9EWOXuJZUIn3b%2FstWNupKq5ldctHSeoXq108CXVnU5PXYIwBNhyqKWD5sagAG1Z1Ko3snZsjO1a1IJYsOspEmZv0%2BXU7OWdkAiwCQrcVVnAyAHbGZ8aZQx2jgys%2BVPP%2BjAliJD6sDK0ERwYbIs0pE%2F%2FOGQAkhN6WXgpQltR1W2sWSdxX5ATy6ua1TtneTFxF379HftCAEbgKOmHPbiz9tzW%2FV9N%2FCwVMnmnzFeoCAA&x-oss-signature-version=OSS4-HMAC-SHA256&x-oss-credential=STS.NYHC4Qu7QfEYgtyjGTyKQn612%2F20260911%2Feu-central-1%2Foss%2Faliyun_v4_request&x-oss-signature=a5211158e981f6f286d02bf7e97af59763eebf01b0968d730475d1dfdb7d4155
R6 = MFR0W4F1803A50: 180kΩ 250V 250mW Metal Film Resistor ±1% ±50ppm/℃ 插件,D2.2xL6.5mm Through Hole Resistors ROHS; Manufacturer: UNI-ROYAL(Uniroyal Elec); Value: 180kΩ; Manufacturer Part Number: MFR0W4F1803A50; LCSC Part Number: C58666; JLCPCB Part Number: C58666; Package: Plugin,D2.2xL6.5mm; ComponentLink1Description: Footprint; ComponentLink1URL: https://jlc-prod-smt.oss-eu-central-1.aliyuncs.com/smtDataManualFile/8588887077518131200-C58666.pdf?response-content-disposition=attachment%3B%20filename%3DC58666.pdf%3B%20filename%2A%3DUTF-8%27%27C58666.pdf&x-oss-date=20260906T133700Z&x-oss-expires=1800&x-oss-security-token=CAISgAN1q6Ft5B2yfSjIr5njeuLttaVw4q%2B4Y1bUtGEyaP1Ohojzpzz2IHhMdHJsAOodtv0%2FmmhT6PkclqRLcbhpcmfjV%2BZHzLB8qcIq%2BVsu557b16cNrbH4M4H6aXeirtuwDsz9SNTCALjPD3nPii50x5bjaDymRCbLGJaViJlhHLN1Ow6jdmhpCctxLAlvo9NgFxm3D%2Fu2NQPwiWf9FVdhvhEG6Vly8qOi2MaRmFy8yFTx0b0SvJ%2BjYMrmPctoN9JnSdC5mfdzau3a1TJ84gRD0a5wkaVA1zbDs5bfISEIuUzebreLqY03dV4mOvdqIcMe8qigz88fk%2FfIioH6xyxKOexoSCnFTOiiupCcQLPyao9jLu6iayqViY7QaIOTqQohZmkAMwVOasAsI3Ngh4zF97Qt0cVNkXO9gWfLI8DtuMleWqqk1co246HD0eS19jklBdzSlusJRAJJUVBflCeKEaRNSAd3WGhEfM2%2BBt4QT30w5N2u00S8OSMI7tiySaKWD5sagAFyBZ5nSLToOyW0z7C6S%2FMhpew6OezDiPqRMvx66XY9pS51uwdfsn2wi8yZTg9CqHuYkXf4ZXXcjvLCic5ESOd8%2FwIG4uNqRu1t5MbTbrQSd8TFmyIZT1C90epqdNW1JOA2EkooiEEU8ixLOdR1Etq5%2FomnsGPRVTeksDljQCjjiiAA&x-oss-signature-version=OSS4-HMAC-SHA256&x-oss-credential=STS.NZV1XYXzQUmSapePagdrbiMXE%2F20260906%2Feu-central-1%2Foss%2Faliyun_v4_request&x-oss-signature=4b93cb7cff9be7ef9c8b15ae901b43c734fd53e4648c1a05799116552e2faa13
R7 = MFR-25FTE52-4K7: -55℃~+155℃ 250mW 4.7kΩ Metal Film Resistor ±1% ±50ppm/℃ 插件,D2.4xL6.3mm Through Hole Resistors ROHS; Manufacturer: YAGEO; Value: 4.7kΩ; Manufacturer Part Number: MFR-25FTE52-4K7; LCSC Part Number: C173023; JLCPCB Part Number: C173023; Package: Plugin,D2.4xL6.3mm; ComponentLink1Description: Footprint; ComponentLink1URL: https://jlc-prod-smt.oss-eu-central-1.aliyuncs.com/smtDataManualFile/8771707749107277824-C173023.pdf?response-content-disposition=attachment%3B%20filename%3DC173023.pdf%3B%20filename%2A%3DUTF-8%27%27C173023.pdf&x-oss-date=20260906T110137Z&x-oss-expires=1800&x-oss-security-token=CAISgAN1q6Ft5B2yfSjIr5vSO4%2FhhZxI%2Bq2YSHX0pTQQY%2BQe2%2FboiDz2IHhMdHJsAOodtv0%2FmmhT6PkclqRLcbhpcmfjV%2BZHzLB8qZREnVcu557b16cNrbH4M4H6aXeirtuwDsz9SNTCALjPD3nPii50x5bjaDymRCbLGJaViJlhHLN1Ow6jdmhpCctxLAlvo9NgFxm3D%2Fu2NQPwiWf9FVdhvhEG6Vly8qOi2MaRmFy8yFTx0b0SvJ%2BjYMrmPctoN9JnSdC5mfdzau3a1TJ84gRD0a5wkaVA1zbDs5bfISEIuUzebreLqY03dV4mOvdqIcMe8qigz88fk%2FfIioH6xyxKOexoSCnFTOiiupCcQLPyao9jLu6iayqViY7QaIOTqQohZmkAMwVOasAsI3Ngh4zF97Qt0cVNkXO9gWfLI8DtuMleWgpiXuNG46HD0eS19jklBdzSlusJRAJJUVBflCeKEaRNSAd3WGhEfM2%2BBt4QT30w5N2u00S8OSMIYHF9RqKWD5sagAGbau%2Fxe%2BD2roMehcOdm0PLMv7W398Wd9qW6auWIGOJ8yM2mufMKnNuzKDZRrB2n8xqRfVoivNI%2BCfeVUSVLsJDjlvzZ31AQToMdhBOrAOSV9wuJpTD8m86LQRz159fZvu2CuBzwfmd%2B8wbWeOtwDoLyWx%2Bd%2F0Ka0FLrv%2FIvuL9IyAA&x-oss-signature-version=OSS4-HMAC-SHA256&x-oss-credential=STS.NXgp5UhCiMosJSEA4Eok243Cj%2F20260906%2Feu-central-1%2Foss%2Faliyun_v4_request&x-oss-signature=1116386aafb13c20a043ea06afd77c1f1d1df21e84b4082c77487c423f4e3d47
R8 = MF0W4FF2704A50: 2.7MΩ 250V 250mW Metal Film Resistor ±1% ±50ppm/℃ 插件,D2.2xL6.5mm Through Hole Resistors ROHS; Manufacturer: UNI-ROYAL(Uniroyal Elec); Value: 2.7MΩ; Manufacturer Part Number: MF0W4FF2704A50; LCSC Part Number: C2991790; JLCPCB Part Number: C2991790; Package: Plugin,D2.2xL6.5mm; ComponentLink1Description: Footprint; ComponentLink1URL: https://jlc-prod-smt.oss-eu-central-1.aliyuncs.com/smtDataManualFile/8756509401370759168-C2991790.pdf?response-content-disposition=attachment%3B%20filename%3DC2991790.pdf%3B%20filename%2A%3DUTF-8%27%27C2991790.pdf&x-oss-date=20260906T100154Z&x-oss-expires=1800&x-oss-security-token=CAISgAN1q6Ft5B2yfSjIr5rWeez%2Fv7lC0IiPa1bwvEoAT71Ol5bD1zz2IHhMdHJsAOodtv0%2FmmhT6PkclqRLcbhpcmfjV%2BZHzLB8qb4bx1Eu557b16cNrbH4M4H6aXeirtuwDsz9SNTCALjPD3nPii50x5bjaDymRCbLGJaViJlhHLN1Ow6jdmhpCctxLAlvo9NgFxm3D%2Fu2NQPwiWf9FVdhvhEG6Vly8qOi2MaRmFy8yFTx0b0SvJ%2BjYMrmPctoN9JnSdC5mfdzau3a1TJ84gRD0a5wkaVA1zbDs5bfISEIuUzebreLqY03dV4mOvdqIcMe8qigz88fk%2FfIioH6xyxKOexoSCnFTOiiupCcQLPyao9jLu6iayqViY7QaIOTqQohZmkAMwVOasAsI3Ngh4zF97Qt0cVNkXO9gWfLI8DtuMleWkonxNcG46HD0eS19jklBdzSlusJRAJJUVBflCeKEaRNSAd3WGhEfM2%2BBt4QT30w5N2u00S8OSMInBxK8qKWD5sagAE4UE4gskISDgkkmUOAOqQkmxDERSgRapehmtIyqiUnmINqf%2Fe7mduu7Yr1h7WdN14VCvYzNhyIHZnwotTufqqI9gqQmPxd7MybCmWa9YrQOa6FH4HxAfg%2FPn30MZ%2BuqC8fyTltcZzXzlZfTkArX8MWh2hCnLGuQWVjeheR9INpwyAA&x-oss-signature-version=OSS4-HMAC-SHA256&x-oss-credential=STS.NYc2VKRfcgJdipAXJUC2bxSh5%2F20260906%2Feu-central-1%2Foss%2Faliyun_v4_request&x-oss-signature=efb9bb1ddd3f6f5cf4e1a357552c83cd03712dc817c5588f09d0fcc9635fb48a
R9 R11 = MFR-25FTF52-2K2: -55℃~+155℃ 2.2kΩ 250mW Metal Film Resistor ±1% ±100ppm/℃ 插件,D2.4xL6.3mm Through Hole Resistors ROHS; Manufacturer: YAGEO; Value: 2.2kΩ; Manufacturer Part Number: MFR-25FTF52-2K2; LCSC Part Number: C914822; JLCPCB Part Number: C914822; Package: Plugin,D2.4xL6.3mm; ComponentLink1Description: Footprint; ComponentLink1URL: https://jlc-prod-smt.oss-eu-central-1.aliyuncs.com/smtDataManualFile/8590170255218667520-C914822.pdf?response-content-disposition=attachment%3B%20filename%3DC914822.pdf%3B%20filename%2A%3DUTF-8%27%27C914822.pdf&x-oss-date=20260906T110901Z&x-oss-expires=1800&x-oss-security-token=CAISgAN1q6Ft5B2yfSjIr5vSO4%2FhhZxI%2Bq2YSHX0pTQQY%2BQe2%2FboiDz2IHhMdHJsAOodtv0%2FmmhT6PkclqRLcbhpcmfjV%2BZHzLB8qZREnVcu557b16cNrbH4M4H6aXeirtuwDsz9SNTCALjPD3nPii50x5bjaDymRCbLGJaViJlhHLN1Ow6jdmhpCctxLAlvo9NgFxm3D%2Fu2NQPwiWf9FVdhvhEG6Vly8qOi2MaRmFy8yFTx0b0SvJ%2BjYMrmPctoN9JnSdC5mfdzau3a1TJ84gRD0a5wkaVA1zbDs5bfISEIuUzebreLqY03dV4mOvdqIcMe8qigz88fk%2FfIioH6xyxKOexoSCnFTOiiupCcQLPyao9jLu6iayqViY7QaIOTqQohZmkAMwVOasAsI3Ngh4zF97Qt0cVNkXO9gWfLI8DtuMleWgpiXuNG46HD0eS19jklBdzSlusJRAJJUVBflCeKEaRNSAd3WGhEfM2%2BBt4QT30w5N2u00S8OSMIYHF9RqKWD5sagAGbau%2Fxe%2BD2roMehcOdm0PLMv7W398Wd9qW6auWIGOJ8yM2mufMKnNuzKDZRrB2n8xqRfVoivNI%2BCfeVUSVLsJDjlvzZ31AQToMdhBOrAOSV9wuJpTD8m86LQRz159fZvu2CuBzwfmd%2B8wbWeOtwDoLyWx%2Bd%2F0Ka0FLrv%2FIvuL9IyAA&x-oss-signature-version=OSS4-HMAC-SHA256&x-oss-credential=STS.NXgp5UhCiMosJSEA4Eok243Cj%2F20260906%2Feu-central-1%2Foss%2Faliyun_v4_request&x-oss-signature=2d286e58a8ba73440a7beae8dc6ddb285cadd131f4dc8e611f405a437f75ed31
R10 = MFR-25FBF52-20K: -55℃~+155℃ 20kΩ 250mW Metal Film Resistor ±1% ±100ppm/℃ 插件,D2.4xL6.3mm Through Hole Resistors ROHS; Manufacturer: YAGEO; Value: 20kΩ; Manufacturer Part Number: MFR-25FBF52-20K; LCSC Part Number: C1364283; JLCPCB Part Number: C1364283; Package: Plugin,D2.4xL6.3mm; ComponentLink1Description: Footprint; ComponentLink1URL: https://jlc-prod-smt.oss-eu-central-1.aliyuncs.com/smtDataManualFile/8755389697101582336-C1364283.pdf?response-content-disposition=attachment%3B%20filename%3DC1364283.pdf%3B%20filename%2A%3DUTF-8%27%27C1364283.pdf&x-oss-date=20260906T134114Z&x-oss-expires=1800&x-oss-security-token=CAISgAN1q6Ft5B2yfSjIr5njeuLttaVw4q%2B4Y1bUtGEyaP1Ohojzpzz2IHhMdHJsAOodtv0%2FmmhT6PkclqRLcbhpcmfjV%2BZHzLB8qcIq%2BVsu557b16cNrbH4M4H6aXeirtuwDsz9SNTCALjPD3nPii50x5bjaDymRCbLGJaViJlhHLN1Ow6jdmhpCctxLAlvo9NgFxm3D%2Fu2NQPwiWf9FVdhvhEG6Vly8qOi2MaRmFy8yFTx0b0SvJ%2BjYMrmPctoN9JnSdC5mfdzau3a1TJ84gRD0a5wkaVA1zbDs5bfISEIuUzebreLqY03dV4mOvdqIcMe8qigz88fk%2FfIioH6xyxKOexoSCnFTOiiupCcQLPyao9jLu6iayqViY7QaIOTqQohZmkAMwVOasAsI3Ngh4zF97Qt0cVNkXO9gWfLI8DtuMleWqqk1co246HD0eS19jklBdzSlusJRAJJUVBflCeKEaRNSAd3WGhEfM2%2BBt4QT30w5N2u00S8OSMI7tiySaKWD5sagAFyBZ5nSLToOyW0z7C6S%2FMhpew6OezDiPqRMvx66XY9pS51uwdfsn2wi8yZTg9CqHuYkXf4ZXXcjvLCic5ESOd8%2FwIG4uNqRu1t5MbTbrQSd8TFmyIZT1C90epqdNW1JOA2EkooiEEU8ixLOdR1Etq5%2FomnsGPRVTeksDljQCjjiiAA&x-oss-signature-version=OSS4-HMAC-SHA256&x-oss-credential=STS.NZV1XYXzQUmSapePagdrbiMXE%2F20260906%2Feu-central-1%2Foss%2Faliyun_v4_request&x-oss-signature=5255ac2965f6fd3f7ed1f8f768bc2b1677833e959dab1a4e0f80f99292c53270
R12 = MFR-25FBF52-200K: -55℃~+155℃ 200kΩ 250mW Metal Film Resistor ±1% ±100ppm/℃ 插件,D2.4xL6.3mm Through Hole Resistors ROHS; Manufacturer: YAGEO; Value: 200kΩ; Manufacturer Part Number: MFR-25FBF52-200K; LCSC Part Number: C1364207; JLCPCB Part Number: C1364207; Package: Plugin,D2.4xL6.3mm; ComponentLink1Description: Footprint; ComponentLink1URL: https://jlc-prod-smt.oss-eu-central-1.aliyuncs.com/smtDataManualFile/8755389661554855936-C1364207.pdf?response-content-disposition=attachment%3B%20filename%3DC1364207.pdf%3B%20filename%2A%3DUTF-8%27%27C1364207.pdf&x-oss-date=20260906T100636Z&x-oss-expires=1800&x-oss-security-token=CAISgAN1q6Ft5B2yfSjIr5rWeez%2Fv7lC0IiPa1bwvEoAT71Ol5bD1zz2IHhMdHJsAOodtv0%2FmmhT6PkclqRLcbhpcmfjV%2BZHzLB8qb4bx1Eu557b16cNrbH4M4H6aXeirtuwDsz9SNTCALjPD3nPii50x5bjaDymRCbLGJaViJlhHLN1Ow6jdmhpCctxLAlvo9NgFxm3D%2Fu2NQPwiWf9FVdhvhEG6Vly8qOi2MaRmFy8yFTx0b0SvJ%2BjYMrmPctoN9JnSdC5mfdzau3a1TJ84gRD0a5wkaVA1zbDs5bfISEIuUzebreLqY03dV4mOvdqIcMe8qigz88fk%2FfIioH6xyxKOexoSCnFTOiiupCcQLPyao9jLu6iayqViY7QaIOTqQohZmkAMwVOasAsI3Ngh4zF97Qt0cVNkXO9gWfLI8DtuMleWkonxNcG46HD0eS19jklBdzSlusJRAJJUVBflCeKEaRNSAd3WGhEfM2%2BBt4QT30w5N2u00S8OSMInBxK8qKWD5sagAE4UE4gskISDgkkmUOAOqQkmxDERSgRapehmtIyqiUnmINqf%2Fe7mduu7Yr1h7WdN14VCvYzNhyIHZnwotTufqqI9gqQmPxd7MybCmWa9YrQOa6FH4HxAfg%2FPn30MZ%2BuqC8fyTltcZzXzlZfTkArX8MWh2hCnLGuQWVjeheR9INpwyAA&x-oss-signature-version=OSS4-HMAC-SHA256&x-oss-credential=STS.NYc2VKRfcgJdipAXJUC2bxSh5%2F20260906%2Feu-central-1%2Foss%2Faliyun_v4_request&x-oss-signature=8ee0dc9ba41a664903cf3965d51a3b18424dbbdc6187841ff3272000787afc55
R13 R14 = MFR-25FTE52-100K: -55℃~+155℃ 100kΩ 250mW Metal Film Resistor ±1% ±50ppm/℃ 插件,D2.4xL6.3mm Through Hole Resistors ROHS; Manufacturer: YAGEO; Value: 100kΩ; Manufacturer Part Number: MFR-25FTE52-100K; LCSC Part Number: C172965; JLCPCB Part Number: C172965; Package: Plugin,D2.4xL6.3mm; ComponentLink1Description: Footprint; ComponentLink1URL: https://jlc-prod-smt.oss-eu-central-1.aliyuncs.com/smtDataManualFile/8755418925352140800-C172965.pdf?response-content-disposition=attachment%3B%20filename%3DC172965.pdf%3B%20filename%2A%3DUTF-8%27%27C172965.pdf&x-oss-date=20260906T100955Z&x-oss-expires=1800&x-oss-security-token=CAISgAN1q6Ft5B2yfSjIr5rWeez%2Fv7lC0IiPa1bwvEoAT71Ol5bD1zz2IHhMdHJsAOodtv0%2FmmhT6PkclqRLcbhpcmfjV%2BZHzLB8qb4bx1Eu557b16cNrbH4M4H6aXeirtuwDsz9SNTCALjPD3nPii50x5bjaDymRCbLGJaViJlhHLN1Ow6jdmhpCctxLAlvo9NgFxm3D%2Fu2NQPwiWf9FVdhvhEG6Vly8qOi2MaRmFy8yFTx0b0SvJ%2BjYMrmPctoN9JnSdC5mfdzau3a1TJ84gRD0a5wkaVA1zbDs5bfISEIuUzebreLqY03dV4mOvdqIcMe8qigz88fk%2FfIioH6xyxKOexoSCnFTOiiupCcQLPyao9jLu6iayqViY7QaIOTqQohZmkAMwVOasAsI3Ngh4zF97Qt0cVNkXO9gWfLI8DtuMleWkonxNcG46HD0eS19jklBdzSlusJRAJJUVBflCeKEaRNSAd3WGhEfM2%2BBt4QT30w5N2u00S8OSMInBxK8qKWD5sagAE4UE4gskISDgkkmUOAOqQkmxDERSgRapehmtIyqiUnmINqf%2Fe7mduu7Yr1h7WdN14VCvYzNhyIHZnwotTufqqI9gqQmPxd7MybCmWa9YrQOa6FH4HxAfg%2FPn30MZ%2BuqC8fyTltcZzXzlZfTkArX8MWh2hCnLGuQWVjeheR9INpwyAA&x-oss-signature-version=OSS4-HMAC-SHA256&x-oss-credential=STS.NYc2VKRfcgJdipAXJUC2bxSh5%2F20260906%2Feu-central-1%2Foss%2Faliyun_v4_request&x-oss-signature=a5c55aa19f9a7a777347e665f5e32691cf02c8186d1a0df1a4a6816c34bb2bbb
U1 = OP07CP: Low-offset voltage (0.25 mV) single operational amplifier / -18V~-3V、3V~18V 0.3V/us 0℃~+70℃ 1 1.8nA 10.5nV/√Hz@10Hz 120dB 500nV/℃ 600kHz 60uV 800pA Built-in compensation PDIP-8 Precision Op Amps ROHS; MF: Texas Instruments; SnapEDA_Link: https://www.snapeda.com/parts/OP07CP/Texas+Instruments/view-part/?ref=snap; Package: PDIP-8 Texas; Value: *; MP: OP07CP; Check_prices: https://www.snapeda.com/parts/OP07CP/Texas+Instruments/view-part/?ref=eda; LCSC Part Number: C5224; JLCPCB Part Number: C5224; Packaging: PDIP-8
U2 U3 = TL072CPE4: Dual Low-Noise JFET-Input General-Purpose Operational Amplifier 8-PDIP 0 to 70 / -15V~15V 0℃~+70℃ 1.4mA 100pA 13V/us 18nV/√Hz@1kHz 18uV/℃ 2 3MHz 3mV 65pA 70dB Short-Circuit  Protection、Built-in compensation、Latch-up suppression PDIP-8 FET Input Amplifiers ROHS; MF: Texas Instruments; SnapEDA_Link: https://www.snapeda.com/parts/TL072CPE4/Texas+Instruments/view-part/?ref=snap; Package: PDIP-8 Texas; Value: *; MP: TL072CPE4; Check_prices: https://www.snapeda.com/parts/TL072CPE4/Texas+Instruments/view-part/?ref=eda; LCSC Part Number: C7236; JLCPCB Part Number: C7236; Packaging: PDIP-8; ComponentLink1Description: Datasheet; ComponentLink1URL: https://www.ti.com/cn/lit/gpn/tl072
VR1 = 3296W-1-104LF: 100kΩ 25 500mW ±10% ±100ppm/℃ SIP-3P,9.5x4.8mm Potentiometers, Variable Resistors ROHS; MF: Bourns; SnapEDA_Link: https://www.snapeda.com/parts/3296W-1-104LF/Bourns/view-part/?ref=snap; Package: NON STANDARD-3 Bourns; Value: 100kΩ; MP: 3296W-1-104LF; Check_prices: https://www.snapeda.com/parts/3296W-1-104LF/Bourns/view-part/?ref=eda; JLCPCB Part Number: C48084; LCSC Part Number: C48084; Packaging: SIP-3P,9.5x4.8mm; ComponentLink1Description: Datasheet; ComponentLink1URL: https://jlc-prod-smt.oss-eu-central-1.aliyuncs.com/smtDataManualFile/8588893908663750656-C48084.pdf?response-content-disposition=attachment%3B%20filename%3DC48084.pdf%3B%20filename%2A%3DUTF-8%27%27C48084.pdf&x-oss-date=20260906T142126Z&x-oss-expires=1800&x-oss-security-token=CAISgAN1q6Ft5B2yfSjIr5vDKo7hpqpL7ozYQxH7t1c3O8QVrb3NqTz2IHhMdHJsAOodtv0%2FmmhT6PkclqRLcbhpcmfjV%2BZHzLB8qfdWt1ku557b16cNrbH4M4H6aXeirtuwDsz9SNTCALjPD3nPii50x5bjaDymRCbLGJaViJlhHLN1Ow6jdmhpCctxLAlvo9NgFxm3D%2Fu2NQPwiWf9FVdhvhEG6Vly8qOi2MaRmFy8yFTx0b0SvJ%2BjYMrmPctoN9JnSdC5mfdzau3a1TJ84gRD0a5wkaVA1zbDs5bfISEIuUzebreLqY03dV4mOvdqIcMe8qigz88fk%2FfIioH6xyxKOexoSCnFTOiiupCcQLPyao9jLu6iayqViY7QaIOTqQohZmkAMwVOasAsI3Ngh4zF97Qt0cVNkXO9gWfLI8DtuMleWmruE1jHLjvyAFpORa%2Bb5wchMHn6pr9EWOXuJZUIn3b%2FstWNupKq5ldctHSeoXq108CXVnU5PXYIP5O%2FGqKWD5sagAGyCrekBlsAT2FIxnm2MFOfLvd42oLE35rahSki9MPf3JcF5R%2F2Pfjmxez%2FjkCAK0aFrjFaj3CSznQwV4nVyOW6qUasOSwt61YhmjGTlCj%2BP4Dbyptjc%2BuN2YwpfEu1vnEtwpWw8TnDzSvJxj8n9Q9IsE8jxxBqX9wwDPa6q0GrISAA&x-oss-signature-version=OSS4-HMAC-SHA256&x-oss-credential=STS.NXva4UKujYN3A7JSWb7K9BxfK%2F20260906%2Feu-central-1%2Foss%2Faliyun_v4_request&x-oss-signature=e75ac0ab24145842701765cd8d6799db0728ff79845541a77d28db743b53723d
VR2 = 3296W-1-101: TRIMMER - 3/8in SQ MT CERMET | Bourns 3296W-1-101 / 100Ω 30 500mW ±10% ±250ppm/℃ 插件-3P,9.5x4.9mm Potentiometers, Variable Resistors ROHS; SnapEDA_Link: https://www.snapeda.com/parts/3296W-1-101/Bourns/view-part/?ref=snap; Package: NON STANDARD-3 Bourns; Value: 100; MF: Bourns; MP: 3296W-1-101; Check_prices: https://www.snapeda.com/parts/3296W-1-101/Bourns/view-part/?ref=eda; LCSC Part Number: C118961; JLCPCB Part Number: C118961; Packaging: Plugin-3P,9.5x4.9mm; ComponentLink1Description: Datasheet; ComponentLink1URL: https://jlc-prod-smt.oss-eu-central-1.aliyuncs.com/smtDataManualFile/8588896635821047808-C118961.pdf?response-content-disposition=attachment%3B%20filename%3DC118961.pdf%3B%20filename%2A%3DUTF-8%27%27C118961.pdf&x-oss-date=20260825T065028Z&x-oss-expires=1800&x-oss-security-token=CAISgAN1q6Ft5B2yfSjIr5vsH%2Bv%2Bj61n%2FY%2BtSUvftkM2ed9mmpXn2jz2IHhMdHJsAOodtv0%2FmmhT6PkclqRLcbhpcmfjV%2BZHzLB8qfIAvCIq557b16cNrbH4M4H6aXeirtuwDsz9SNTCALjPD3nPii50x5bjaDymRCbLGJaViJlhHLN1Ow6jdmhpCctxLAlvo9NgFxm3D%2Fu2NQPwiWf9FVdhvhEG6Vly8qOi2MaRmFy8yFTx0b0SvJ%2BjYMrmPctoN9JnSdC5mfdzau3a1TJ84gRD0a5wkaVA1zbDs5bfISEIuUzebreLqY03dV4mOvdqIcMe8qigz88fk%2FfIioH6xyxKOexoSCnFTOiiupCcQLPyao9jLu6iayqViY7QaIOTqQohZmkAMwVOasAsI3Ngh4zF97Qt0cVNkXO9gWfLI8DtuMleWmrEeI03TPZqaIWzHOTEFupYY7CDV2HC3D82fcxJ2B%2Bmz7zwy%2B%2Fdqxot7SHZVvl3SE4LlO17v1wIjJpoQqKWD5sagAEgdpkFxWJfWGt8%2F63pzZ6QCF2D5PIsDyEDGRhRAOPE3zY45FgkFp0%2Fzihou7nTmAgt%2BxuLJa5KGSSYWT4u%2B14DP%2Fw6JDR%2BJpTEGE5c%2F7VzgQgnXPa1oCnwAziP93%2BDx0Oh32OxCXeo0CBC5AmLuwuDf7AeuIREBiyb%2BltzpAJuYCAA&x-oss-signature-version=OSS4-HMAC-SHA256&x-oss-credential=STS.NXYTQJbrFJMFKmnRCcuPJuPL8%2F20260825%2Feu-central-1%2Foss%2Faliyun_v4_request&x-oss-signature=4c43236ed8371185a92c99f50fcf807b2f7a1b72fcadc9d556e75dc3d55ed87c